# Altium schematic sheet Laser_System.SchDoc
size A4; Date: *******; ApprovedBy: *******; CheckedBy: None; Author: *******; CompanyName: *******; DrawnBy: Name; Engineer: *******; Organization: *******; Address1: *******; Address2: *******; Address3: *******; Address4: *******; DocumentNumber: Doc Num; Revision: *******; SheetNumber: 8; SheetTotal: 8; CurrentTime: *******; CurrentDate: *******; Time: *******; DocumentFullPathAndName: *******; DocumentName: *******; ModifiedDate: *******; ImagePath: *******; ProjectName: *******; Application_BuildNumber: *******
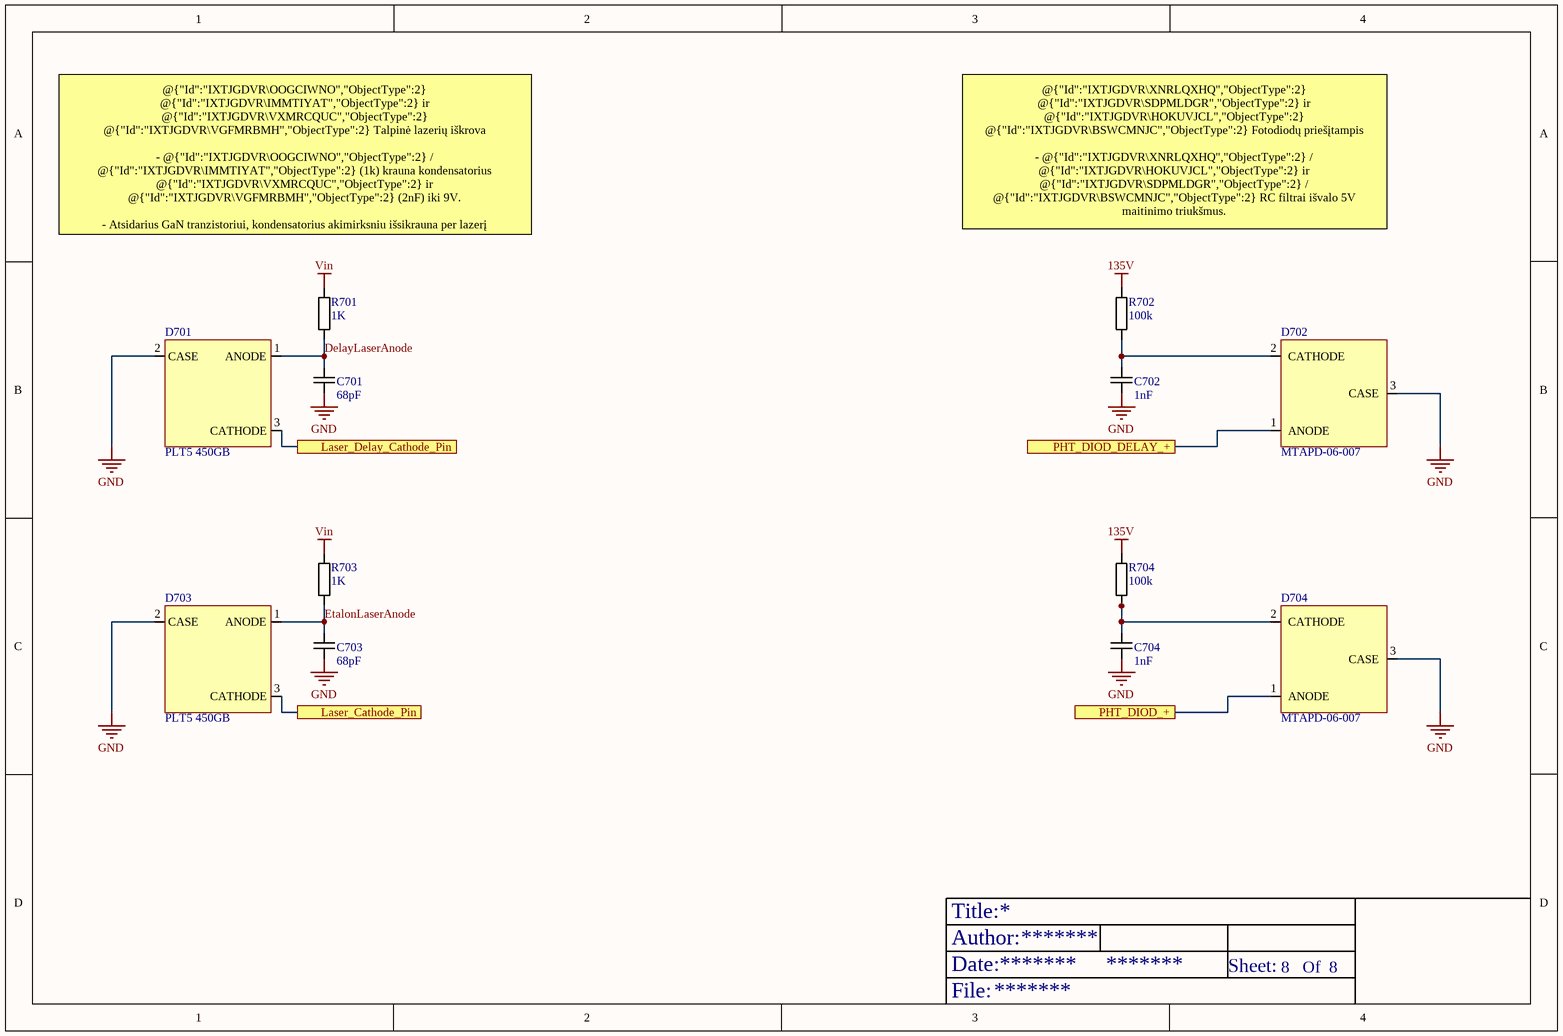
[diagram p0: Laser_System.SchDoc]

## Parts
C701  68pF  [2.2nF 0603]
C702  1nF  [10uF 0805]
C703  68pF  [2.2nF 0603]
C704  1nF  [10uF 0805]
D701  PLT5 450GB  [PLT5 450GB]
D702  MTAPD-06-007  [MTAPD-06-007]
D703  PLT5 450GB  [PLT5 450GB]
D704  MTAPD-06-007  [MTAPD-06-007]
R701  1K  [1k 0603]
R702  100k  [1k 0603]
R703  1K  [1k 0603]
R704  100k  [1k 0603]

## Ports
Laser_Cathode_Pin (see Laser_Driver[3C]), Laser_Delay_Cathode_Pin (see Laser_Driver[3B]), PHT_DIOD_+ (see Light_Detection[2C]), PHT_DIOD_DELAY_+ (see Light_Detection[2B])

## Nets
135V: R702.2 R704.2
GND: C701.1 C702.1 C703.1 C704.1 D701.2(CASE) D702.3(CASE) D703.2(CASE) D704.3(CASE)
Vin: R701.2 R703.2
DelayLaserAnode: C701.2 D701.1(ANODE) R701.1
EtalonLaserAnode: C703.2 D703.1(ANODE) R703.1
Laser_Cathode_Pin: D703.3(CATHODE) ; port Laser_Cathode_Pin
Laser_Delay_Cathode_Pin: D701.3(CATHODE) ; port Laser_Delay_Cathode_Pin
PHT_DIOD_+: D704.1(ANODE) ; port PHT_DIOD_+
PHT_DIOD_DELAY_+: D702.1(ANODE) ; port PHT_DIOD_DELAY_+
NetC702_2: C702.2 D702.2(CATHODE) R702.1
NetC704_2: C704.2 D704.2(CATHODE) R704.1

## Notes on the sheet
- @{"Id":"IXTJGDVR\OOGCIWNO","ObjectType":2} @{"Id":"IXTJGDVR\IMMTIYAT","ObjectType":2} ir @{"Id":"IXTJGDVR\VXMRCQUC","ObjectType":2} @{"Id":"IXTJGDVR\VGFMRBMH","ObjectType":2} Talpinė lazerių iškrova
  - @{"Id":"IXTJGDVR\OOGCIWNO","ObjectType":2} / @{"Id":"IXTJGDVR\IMMTIYAT","ObjectType":2} (1k) krauna kondensatorius @{"Id":"IXTJGDVR\VXMRCQUC","ObjectType":2} ir @{"Id":"IXTJGDVR\VGFMRBMH","ObjectType":2} (2nF) iki 9V.
  - Atsidarius GaN tranzistoriui, kondensatorius akimirksniu išsikrauna per lazerį
  ( @{"Id":"IXTJGDVR\VURCQILD","ObjectType":2} / @{"Id":"IXTJGDVR\NUGRJXVH","ObjectType":2} ) į žemę ir duoda aštrų sub-ns šviesos impulsą.
  - Kondensatoriui išsikrovus lazeris užgęsta pats, o 1k varža apsaugo jį nuo sudegimo.
- @{"Id":"IXTJGDVR\XNRLQXHQ","ObjectType":2} @{"Id":"IXTJGDVR\SDPMLDGR","ObjectType":2} ir @{"Id":"IXTJGDVR\HOKUVJCL","ObjectType":2} @{"Id":"IXTJGDVR\BSWCMNJC","ObjectType":2} Fotodiodų priešįtampis
  - @{"Id":"IXTJGDVR\XNRLQXHQ","ObjectType":2} / @{"Id":"IXTJGDVR\HOKUVJCL","ObjectType":2} ir @{"Id":"IXTJGDVR\SDPMLDGR","ObjectType":2} / @{"Id":"IXTJGDVR\BSWCMNJC","ObjectType":2} RC filtrai išvalo 5V maitinimo triukšmus.
  - Katodai pajungti prie 5V, o Anodai per OPA855 (@{"Id":"EQXASDVB\NMYZCVUP","ObjectType":2} ir @{"Id":"EQXASDVB\IJIHGKBT","ObjectType":2}) sėdi ties 3.3V
  (1.7V atbulinis priešįtampis maksimaliai sumažina diodo talpą ir padidina greitį).
  - Šviesos blyksnio srovė siunčiama tiesiai į OPA855 stiprintuvą.
- Title:
- Date:
- Author:
- Sheet:
- Of
- File:

## Library data of the parts
C701 = 2.2nF 0603: C0603X222K1REC7411
C702 C704 = 1nF 0805: GCM21AR72E102KWB1J
C703 = 2.2nF 0603: C0402C680K5RACAUTO
D701 D703 = PLT5 450GB: Lazeris
R701 R703 = 1K 0603: ERA-3AEB102V
R702 R704 = 100k 0603: CR0603-FX-1003ELF